# Altium project aboalrobotatESP32S2.PrjPcb
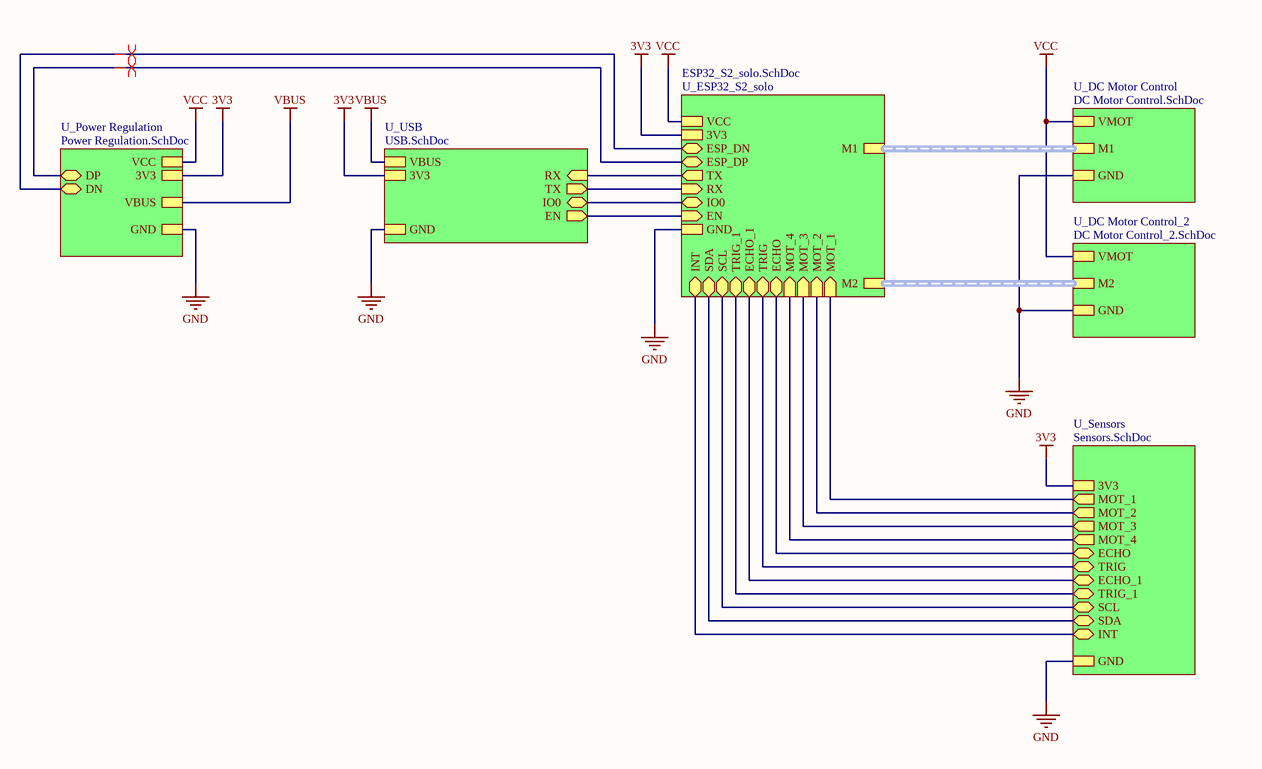
[diagram p0: Block Diagram.SchDoc]
7 sheets, 121 parts. Net scope: strictly hierarchical (ports join the sheet entries above them; power ports are local).
Board file: ESP32_HID.PcbDoc
Sheets:
  Block Diagram.SchDoc
    U_ESP32_S2_solo = ESP32_S2_solo.SchDoc
    U_Power Regulation = Power Regulation.SchDoc
    U_USB = USB.SchDoc
    U_DC Motor Control = DC Motor Control.SchDoc
    U_DC Motor Control_2 = DC Motor Control_2.SchDoc
    U_Sensors = Sensors.SchDoc

## Sheet Block Diagram.SchDoc: Block diagram
size A4; Engineer: Naif Aljophani; DocumentNumber: 1; Revision: V1.0; SheetNumber: 1; SheetTotal: 7

### Sub-sheets
U_DC Motor Control = DC Motor Control.SchDoc: VMOT, GND, M1 (harness M1)
U_DC Motor Control_2 = DC Motor Control_2.SchDoc: VMOT, GND, M2 (harness M2)
U_ESP32_S2_solo = ESP32_S2_solo.SchDoc: 3V3, GND, VCC, IO0 (bidir), EN (in), TX (out), RX (in), M1 (harness M1), M2 (harness M2), ESP_DN (bidir), ESP_DP (bidir), MOT_1 (in), MOT_2 (in), MOT_3 (in), MOT_4 (in), TRIG (bidir), ECHO (bidir), TRIG_1 (bidir), ECHO_1 (bidir), SDA (bidir), INT (bidir), SCL (bidir)
U_Power Regulation = Power Regulation.SchDoc: 3V3, GND, VCC, VBUS, DP (bidir), DN (bidir)
U_Sensors = Sensors.SchDoc: 3V3, MOT_1 (out), MOT_2 (out), MOT_3 (out), MOT_4 (out), GND, TRIG (bidir), ECHO (bidir), TRIG_1 (bidir), ECHO_1 (bidir), SDA (bidir), INT (bidir), SCL (bidir)
U_USB = USB.SchDoc: GND, EN (out), IO0 (bidir), VBUS, RX (in), TX (out), 3V3

### Nets
3V3: sheet U_ESP32_S2_solo/3V3, sheet U_Power Regulation/3V3, sheet U_USB/3V3, sheet U_Sensors/3V3
GND: sheet U_ESP32_S2_solo/GND, sheet U_Power Regulation/GND, sheet U_USB/GND, sheet U_DC Motor Control/GND, sheet U_DC Motor Control_2/GND, sheet U_Sensors/GND
VBUS: sheet U_Power Regulation/VBUS, sheet U_USB/VBUS
VCC: sheet U_ESP32_S2_solo/VCC, sheet U_Power Regulation/VCC, sheet U_DC Motor Control/VMOT, sheet U_DC Motor Control_2/VMOT
D1_N: sheet U_ESP32_S2_solo/ESP_DN, sheet U_Power Regulation/DN
D1_P: sheet U_ESP32_S2_solo/ESP_DP, sheet U_Power Regulation/DP
EN: sheet U_ESP32_S2_solo/EN, sheet U_USB/EN
GLCD_CON1: sheet U_ESP32_S2_solo/SCL, sheet U_Sensors/SCL
GLCD_CON2: sheet U_ESP32_S2_solo/SDA, sheet U_Sensors/SDA
GLCD_CON3: sheet U_ESP32_S2_solo/INT, sheet U_Sensors/INT
IO0: sheet U_ESP32_S2_solo/IO0, sheet U_USB/IO0
IO1: sheet U_ESP32_S2_solo/TRIG_1, sheet U_Sensors/TRIG_1
IO2: sheet U_ESP32_S2_solo/ECHO_1, sheet U_Sensors/ECHO_1
IO3: sheet U_ESP32_S2_solo/MOT_4, sheet U_Sensors/MOT_4
IO16: sheet U_ESP32_S2_solo/MOT_1, sheet U_Sensors/MOT_1
IO17: sheet U_ESP32_S2_solo/MOT_2, sheet U_Sensors/MOT_2
IO18: sheet U_ESP32_S2_solo/MOT_3, sheet U_Sensors/MOT_3
IO33: sheet U_ESP32_S2_solo/TRIG, sheet U_Sensors/TRIG
IO45: sheet U_ESP32_S2_solo/ECHO, sheet U_Sensors/ECHO
UART1: sheet U_ESP32_S2_solo/RX, sheet U_USB/TX
UART2: sheet U_ESP32_S2_solo/TX, sheet U_USB/RX

### Buses and harness runs
harness sheet U_DC Motor Control/M1 = sheet U_ESP32_S2_solo/M1
harness sheet U_DC Motor Control_2/M2 = sheet U_ESP32_S2_solo/M2

### Layout directives
differential pair: D1_N, D1_P

## Sheet ESP32_S2_solo.SchDoc
size A4; Engineer: Naif Aljohani; DocumentNumber: 3; Revision: v1.0; SheetNumber: 2; SheetTotal: 7; SPICEModelCacheSFRKXKUM: <root> / <DocumentId>SFRKXKUM</DocumentId> / </root>
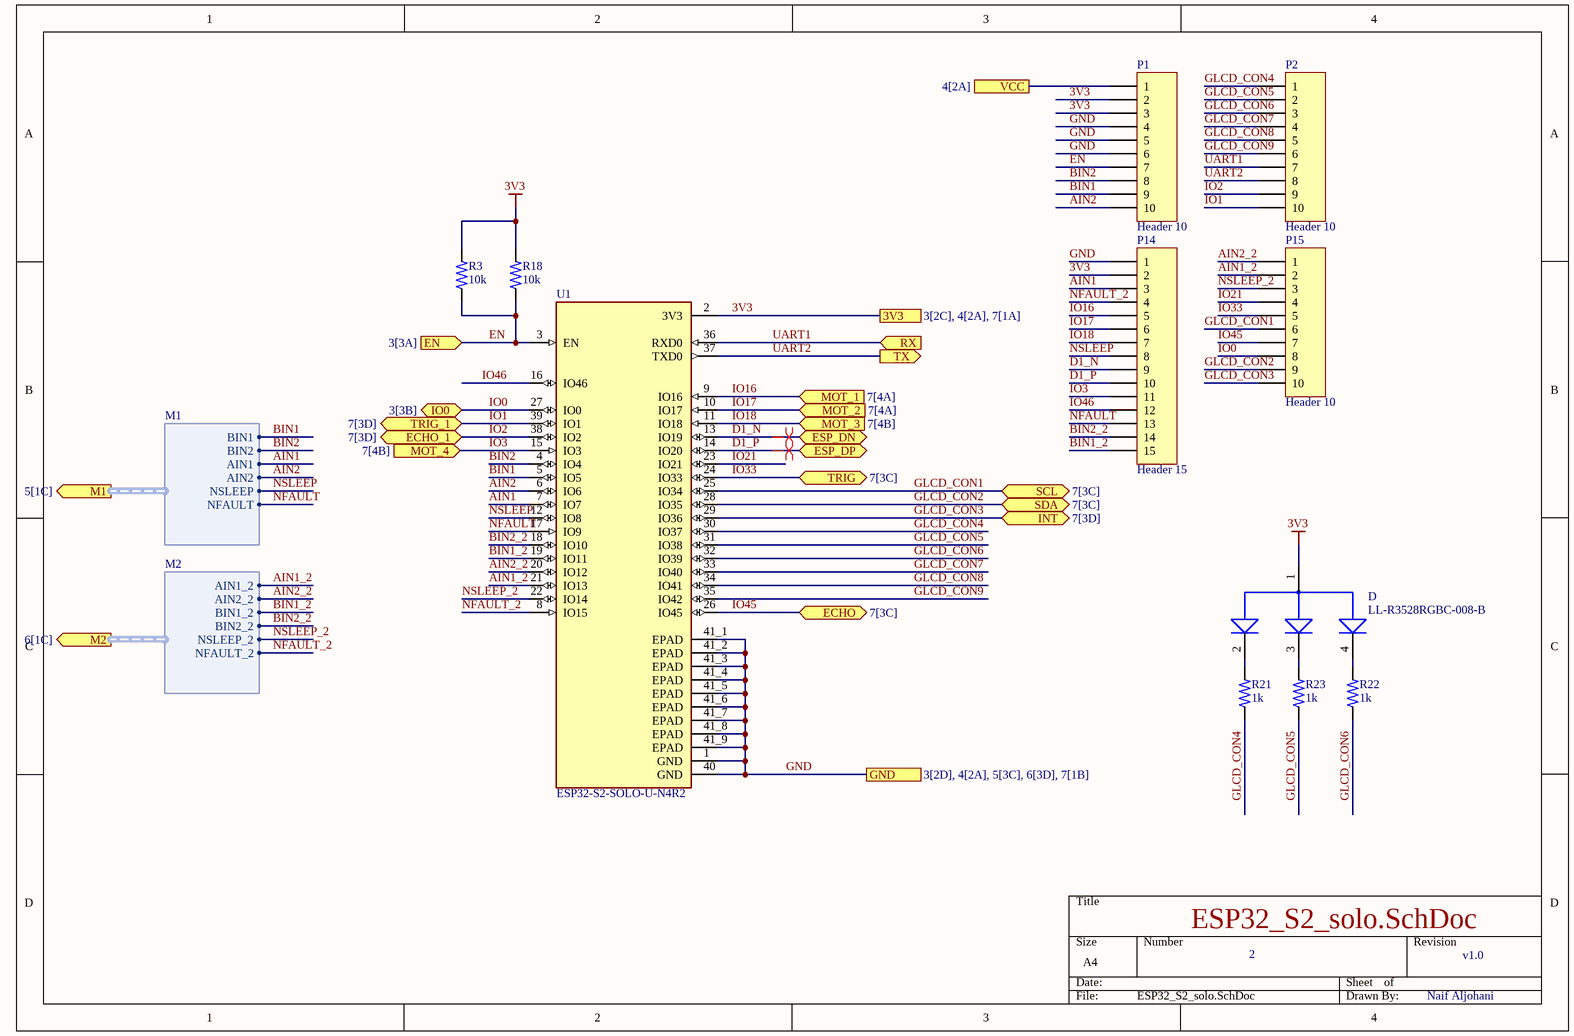
[diagram p1: ESP32_S2_solo.SchDoc]

### Parts
D  LL-R3528RGBC-008-B  [LED_LL-R3528RGBC-008-B]
P1  Header 10  [HDR1X10]
P2  Header 10  [HDR1X10]
P14  Header 15  [HDR1X15]
P15  Header 10  [HDR1X10]
R3  10k  [RESC3115X65N]
R18  10k  [RESC3115X65N]
R21  1k  [RESC3115X65N]
R22  1k  [RESC3115X65N]
R23  1k  [RESC3115X65N]
U1  ESP32-S2-SOLO-U-N4R2  [XCVR_ESP32-S2-SOLO-U-N4R2]

### Ports
3V3 (see 3[2C], 4[2A], 7[1A]), ECHO (bidir, see 7[3C]), ECHO_1 (bidir, see 7[3D]), EN (in, see 3[3A]), ESP_DN (bidir), ESP_DP (bidir), GND (see 3[2D], 4[2A], 5[3C], 6[3D], 7[1B]), INT (bidir, see 7[3D]), IO0 (bidir, see 3[3B]), M1 (out, harness M1, see 5[1C]), M2 (out, harness M2, see 6[1C]), MOT_1 (in, see 7[4A]), MOT_2 (in, see 7[4A]), MOT_3 (in, see 7[4B]), MOT_4 (in, see 7[4B]), RX (in), SCL (bidir, see 7[3C]), SDA (bidir, see 7[3C]), TRIG (bidir, see 7[3C]), TRIG_1 (bidir, see 7[3D]), TX (out), VCC (see 4[2A])

### Harnesses
M1: BIN1, BIN2, AIN1, AIN2, NSLEEP, NFAULT
M2: AIN1_2, AIN2_2, BIN1_2, BIN2_2, NSLEEP_2, NFAULT_2

### Nets
3V3: D.1(COMM_ANODE) P1.2 P1.3 P14.2 R3.2 R18.2 U1.2(3V3) ; port 3V3
GND: P1.4 P1.5 P1.6 P14.1 U1.1(GND) U1.40(GND) U1.41_1(EPAD) U1.41_2(EPAD) U1.41_3(EPAD) U1.41_4(EPAD) U1.41_5(EPAD) U1.41_6(EPAD) U1.41_7(EPAD) U1.41_8(EPAD) U1.41_9(EPAD) ; port GND
VCC: P1.1 ; port VCC
AIN1: P14.3 U1.7(IO7) ; port M1.AIN1
AIN1_2: P15.2 U1.21(IO13) ; port M2.AIN1_2
AIN2: P1.10 U1.6(IO6) ; port M1.AIN2
AIN2_2: P15.1 U1.20(IO12) ; port M2.AIN2_2
BIN1: P1.9 U1.5(IO5) ; port M1.BIN1
BIN1_2: P14.15 U1.19(IO11) ; port M2.BIN1_2
BIN2: P1.8 U1.4(IO4) ; port M1.BIN2
BIN2_2: P14.14 U1.18(IO10) ; port M2.BIN2_2
D1_N: P14.9 U1.13(IO19) ; port ESP_DN
D1_P: P14.10 U1.14(IO20) ; port ESP_DP
EN: P1.7 R3.1 R18.1 U1.3(EN) ; port EN
GLCD_CON1: P15.6 U1.25(IO34) ; port SCL
GLCD_CON2: P15.9 U1.28(IO35) ; port SDA
GLCD_CON3: P15.10 U1.29(IO36) ; port INT
GLCD_CON4: P2.1 R21.1 U1.30(IO37)
GLCD_CON5: P2.2 R23.1 U1.31(IO38)
GLCD_CON6: P2.3 R22.1 U1.32(IO39)
GLCD_CON7: P2.4 U1.33(IO40)
GLCD_CON8: P2.5 U1.34(IO41)
GLCD_CON9: P2.6 U1.35(IO42)
IO0: P15.8 U1.27(IO0) ; port IO0
IO1: P2.10 U1.39(IO1) ; port TRIG_1
IO2: P2.9 U1.38(IO2) ; port ECHO_1
IO3: P14.11 U1.15(IO3) ; port MOT_4
IO16: P14.5 U1.9(IO16) ; port MOT_1
IO17: P14.6 U1.10(IO17) ; port MOT_2
IO18: P14.7 U1.11(IO18) ; port MOT_3
IO21: P15.4 U1.23(IO21)
IO33: P15.5 U1.24(IO33) ; port TRIG
IO45: P15.7 U1.26(IO45) ; port ECHO
IO46: P14.12 U1.16(IO46)
NFAULT: P14.13 U1.17(IO9) ; port M1.NFAULT
NFAULT_2: P14.4 U1.8(IO15) ; port M2.NFAULT_2
NSLEEP: P14.8 U1.12(IO8) ; port M1.NSLEEP
NSLEEP_2: P15.3 U1.22(IO14) ; port M2.NSLEEP_2
UART1: P2.7 U1.36(RXD0) ; port RX
UART2: P2.8 U1.37(TXD0) ; port TX
NetD_2: D.2(CATHODE_RED) R21.2
NetD_3: D.3(CATHODE_GREEN) R23.2
NetD_4: D.4(CATHODE_BLUE) R22.2

### Layout directives
differential pair: D1_N, D1_P

### Library data of the parts
D = LL-R3528RGBC-008-B: LED; SMD; 3528, PLCC2; RGB; 3.5x2.8mm; 120Â°; Red lumin: 1; MF: Lucky Light; Package: PLCC-2 Lucky Light; Availability: Unavailable; Value: *; MP: LL-R3528RGBC-008-B; SnapEDA_Link: https://www.snapeda.com/parts/LL-R3528RGBC-008-B/Lucky%20Light/view-part/47649/?ref=snap; Price: None
P1 P2 P15 = Header 10: Header, 10-Pin; LatestRevisionDate: 17-Jul-2002; LatestRevisionNote: Re-released for DXP Platform.; Publisher: Altium Limited
P14 = Header 15: Header, 15-Pin; LatestRevisionDate: 17-Jul-2002; LatestRevisionNote: Re-released for DXP Platform.; Publisher: Altium Limited
R3 R18 R21-R23 = 1-1879462-4: RL73H 2B R43 1% 5K RL; MF: {'manufacturer': u'TE Connectivity'}; Package: None; Price: None; Value: *; MP: 1-1879462-4; Availability: Unavailable
U1 = ESP32-S2-SOLO-U-N4R2: MF: {'manufacturer': u'Espressif Systems'}; Package: None; Price: None; MP: ESP32-S2-SOLO-U-N4R2; Availability: Unavailable; Value: *

## Sheet Power Regulation.SchDoc
size A4; Engineer: Naif Aljohani; DocumentNumber: 7; Revision: v1.0; SheetNumber: 4; SheetTotal: 7
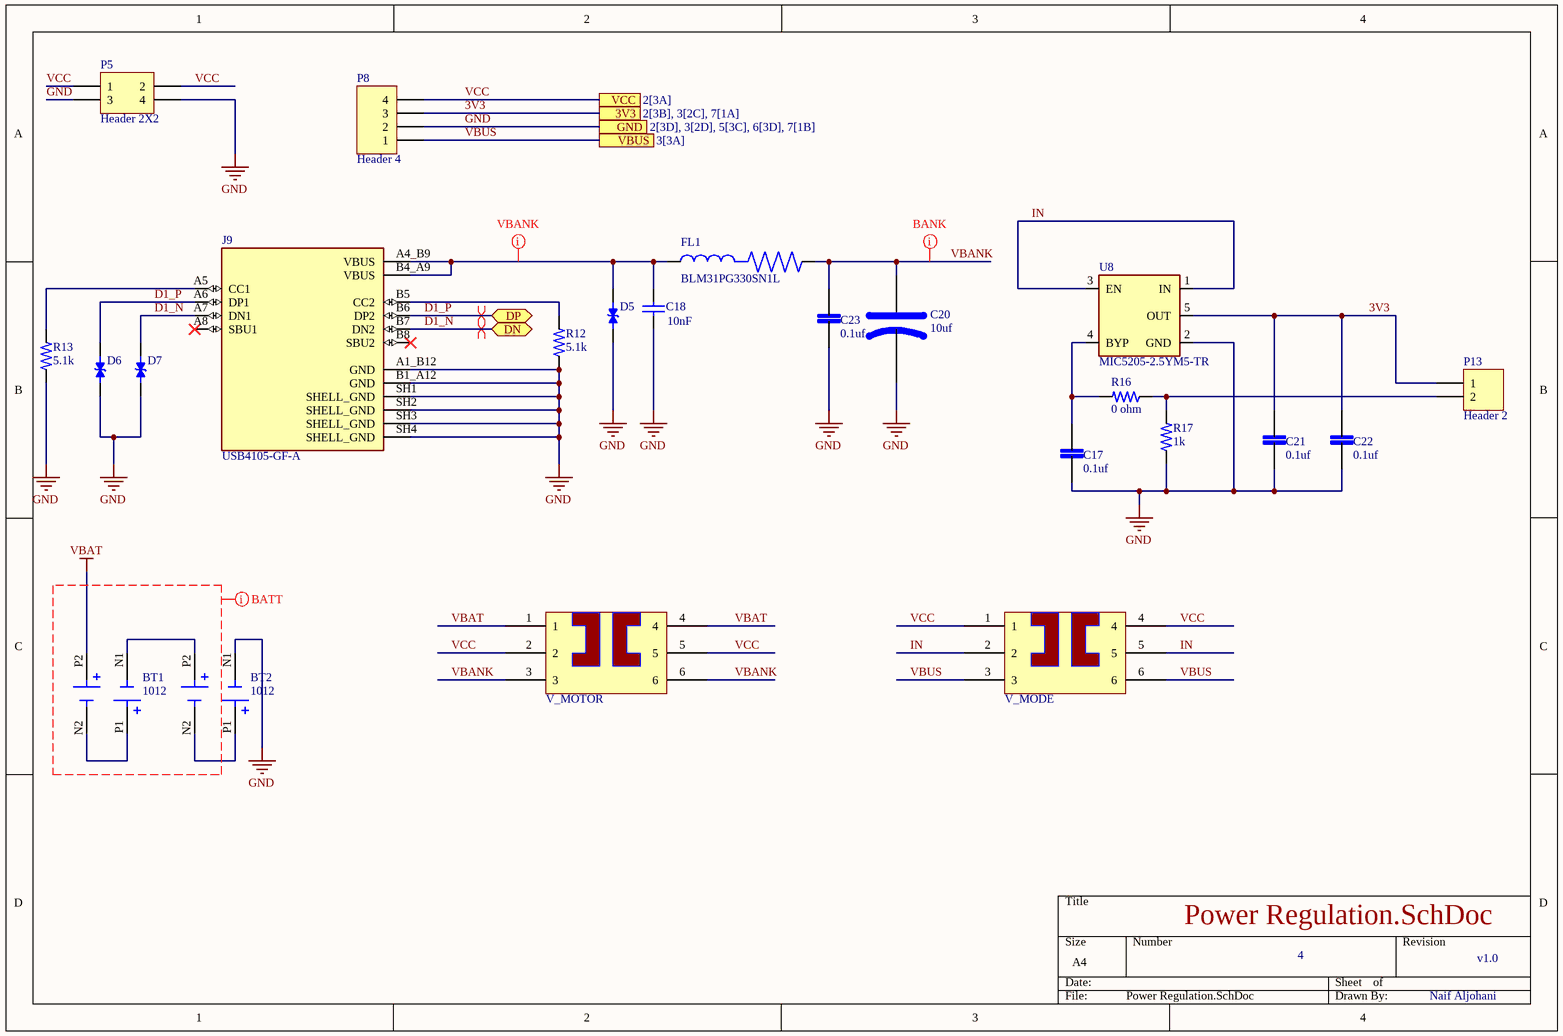
[diagram p2: Power Regulation.SchDoc]

### Parts
BT1  1012  [BAT_1012]
BT2  1012  [BAT_1012]
C17  0.1uf  [CAPC2012X140N]
C18  value 10nF  [C1206]  (hidden comment: Cap Semi)
C20  10uf  [CAPAE660X550N]
C21  0.1uf  [CAPC2012X140N]
C22  0.1uf  [CAPC2012X140N]
C23  0.1uf  [CAPC2012X140N]
D5  LESD5D5.0CT1G  [TVS_LESD5D5.0CT1G]  (value not drawn)
D6  LESD5D5.0CT1G  [TVS_LESD5D5.0CT1G]  (value not drawn)
D7  LESD5D5.0CT1G  [TVS_LESD5D5.0CT1G]  (value not drawn)
FL1  BLM31PG330SN1L  [BEADC3216X130N]
J9  USB4105-GF-A  [GCT_USB4105-GF-A]
P5  Header 2X2  [HDR2X2]
P8  Header 4  [HDR1X4]
P13  Header 2  [HDR1X2]
R12  5.1k  [RESC3115X65N]
R13  5.1k  [RESC3115X65N]
R16  0 ohm  [RESC3115X65N]
R17  1k  [RESC3115X65N]
U8  MIC5205-2.5YM5-TR  [SOT95P280X145-5N]
V_MODE  MS-22C01-G010  [G Switch]  (value not drawn)
V_MOTOR  MS-22C01-G010  [G Switch]  (value not drawn)

### Ports
3V3 (see 2[3B], 3[2C], 7[1A]), DN (bidir), DP (bidir), GND (see 2[3D], 3[2D], 5[3C], 6[3D], 7[1B]), VBUS (see 3[3A]), VCC (see 2[3A])

### Nets
3V3: C21.2 C22.2 P8.3 P13.1 U8.5(OUT) ; port 3V3
GND: BT2.N1(NEG1) C17.1 C18.1 C20.N C21.1 C22.1 C23.1 D5.1 D6.1 D7.1 J9.A1_B12(GND) J9.B1_A12(GND) J9.SH1(SHELL_GND) J9.SH2(SHELL_GND) J9.SH3(SHELL_GND) J9.SH4(SHELL_GND) P5.3 P5.4 P8.2 R12.1 R13.1 R17.1 U8.2(GND) ; port GND
VBAT: BT1.P2(POS2) V_MOTOR.1 V_MOTOR.4
VBUS: P8.1 V_MODE.3 V_MODE.6 ; port VBUS
VCC: P5.1 P5.2 P8.4 V_MODE.1 V_MODE.4 V_MOTOR.2 V_MOTOR.5 ; port VCC
D1_N: D7.2 J9.A7(DN1) J9.B7(DN2) ; port DN
D1_P: D6.2 J9.A6(DP1) J9.B6(DP2) ; port DP
IN: U8.1(IN) U8.3(EN) V_MODE.2 V_MODE.5
VBANK: C20.P C23.2 FL1.2 V_MOTOR.3 V_MOTOR.6
NetBT1_N1: BT1.N1(NEG1) BT2.P2(POS2)
NetBT1_N2: BT1.N2(NEG2) BT1.P1(POS1)
NetBT2_N2: BT2.N2(NEG2) BT2.P1(POS1)
NetC17_2: C17.2 R16.2 U8.4(BYP)
NetC18_2: C18.2 D5.2 FL1.1 J9.A4_B9(VBUS) J9.B4_A9(VBUS)
NetJ9_A5: J9.A5(CC1) R13.2
NetJ9_B5: J9.B5(CC2) R12.2
NetP13_2: P13.2 R16.1 R17.2

Not connected (* = marked no-connect by the designer): J9 A8(SBU1)* B8(SBU2)*

### Layout directives
differential pair: D1_N, D1_P
rule Width Constraint [Pref Width = 0.5mm    Min Width = 0.254mm    Max Width = 1mm]: (no net found under the mark)
rule Width Constraint [Pref Width = 0.5mm    Min Width = 0.3mm    Max Width = 1mm]: VBANK
rule Width Constraint [Pref Width = 0.254mm    Min Width = 0.254mm    Max Width = 0.5mm]: NetC18_2

### Library data of the parts
C17 C21-C23 = LD051A121KAB2A: 120PF 100V 10% 0805; MF: {'manufacturer': u'AVX'}; Package: None; Price: None; Value: *; MP: LD051A121KAB2A; Availability: Unavailable
C18 = Cap Semi: Capacitor (Semiconductor SIM Model); Published: 8-Jun-2000; LatestRevisionDate: 29-May-2009; LatestRevisionNote: IPC-7351 Footprint Added.; PackageReference: C1206; Publisher: Altium Limited; PackageDescription: Chip Capacitor
C20 = UWX1H100MCL1GB
D5-D7 = LESD5D5.0CT1G: MF: {'manufacturer': u'Leshan Radio Co.'}; Package: None; Price: None; Value: *; MP: LESD5D5.0CT1G; Availability: Unavailable
FL1 = BLM31PG330SN1L: Ferrite Beads Multi-Layer 33Ohm 25% 100MHz 6A 9mOhm DCR 1206 T/R; MF: {'manufacturer': u'Murata Electronics'}; Package: None; Price: None; Value: *; MP: BLM31PG330SN1L; Availability: Unavailable
J9 = USB4105-GF-A: MF: {'manufacturer': u'GCT'}; Package: None; Price: None; Value: *; MP: USB4105-GF-A; Availability: Unavailable
P5 = Header 2X2: Header, 2-Pin, Dual row; LatestRevisionDate: 17-Jul-2002; LatestRevisionNote: Re-released for DXP Platform.; Publisher: Altium Limited
P8 = Header 4: Header, 4-Pin; LatestRevisionDate: 17-Jul-2002; LatestRevisionNote: Re-released for DXP Platform.; Publisher: Altium Limited
P13 = Header 2: Header, 2-Pin; LatestRevisionDate: 17-Jul-2002; LatestRevisionNote: Re-released for DXP Platform.; Publisher: Altium Limited
R12 R13 R16 R17 = 1-1879462-4: as R3 on sheet ESP32_S2_solo; Package: None; Price: None; Value: *; MP: 1-1879462-4; Availability: Unavailable
U8 = MIC5205-2.5YM5-TR: MIC5205 Series 3 V Fixed Output 150 mA SMT Low-Noise LDO Regulator - SOT-23-5; MF: {'manufacturer': u'Microchip Technology'}; Price: None; MP: MIC5205-2.5YM5-TR; Availability: Unavailable; Value: *; Package: None
V_MODE V_MOTOR = G-Switch: Standing paste 1A DPDT 6V Black 10000 times SMD Slide Switches ROHS
BT1 BT2 = 1012: Value: *; MP: 1012; Price: None; Package: None; Availability: Unavailable

## Sheet USB.SchDoc
size A4; Engineer: Naif aljohani; DocumentNumber: 4; Revision: v1.0; SheetNumber: 3; SheetTotal: 7; SPICEModelCacheVKQZRFRK: <root> / <DocumentId>VKQZRFRK</DocumentId> / </root>
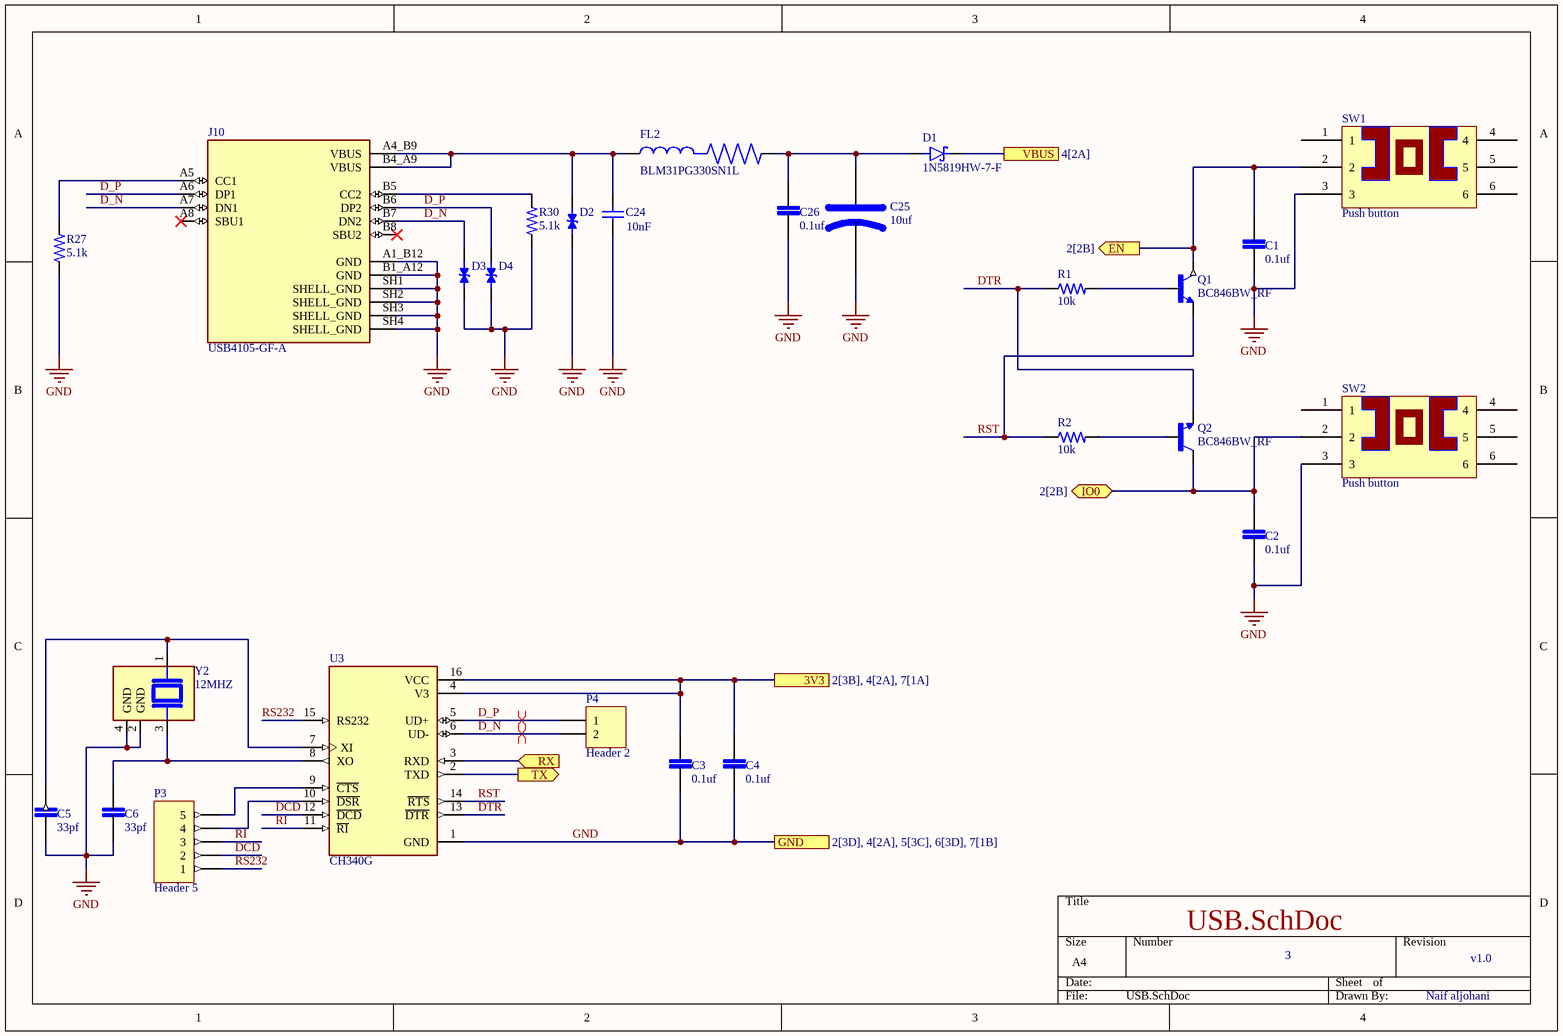
[diagram p3: USB.SchDoc]

### Parts
C1  0.1uf  [CAPC2012X140N]
C2  0.1uf  [CAPC2012X140N]
C3  0.1uf  [CAPC2012X140N]
C4  0.1uf  [CAPC2012X140N]
C5  33pf  [CAPC2012X140N]
C6  33pf  [CAPC2012X140N]
C24  value 10nF  [C1206]  (hidden comment: Cap Semi)
C25  10uf  [CAPAE660X550N]
C26  0.1uf  [CAPC2012X140N]
D1  1N5819HW-7-F  [SOD3715X145N]
D2  LESD5D5.0CT1G  [TVS_LESD5D5.0CT1G]  (value not drawn)
D3  LESD5D5.0CT1G  [TVS_LESD5D5.0CT1G]  (value not drawn)
D4  LESD5D5.0CT1G  [TVS_LESD5D5.0CT1G]  (value not drawn)
FL2  BLM31PG330SN1L  [BEADC3216X130N]
J10  USB4105-GF-A  [GCT_USB4105-GF-A]
P3  Header 5  [HDR1X5]
P4  Header 2  [HDR1X2]
Q1  BC846BW_RF  [TRANS_BC846BW_RF]
Q2  BC846BW_RF  [TRANS_BC846BW_RF]
R1  10k  [RESC3115X65N]
R2  10k  [RESC3115X65N]
R27  5.1k  [RESC3115X65N]
R30  5.1k  [RESC3115X65N]
SW1  Push button  [XKB5858-Z-TP-75]
SW2  Push button  [XKB5858-Z-TP-75]
U3  CH340G  [SOIC127P600X180-16N]
Y2  12MHZ  [XTAL_ABM8W-32.0000MHZ-6-B1U-T3]

### Ports
3V3 (see 2[3B], 4[2A], 7[1A]), EN (out, see 2[2B]), GND (see 2[3D], 4[2A], 5[3C], 6[3D], 7[1B]), IO0 (bidir, see 2[2B]), RX (in), TX (out), VBUS (see 4[2A])

### Nets
3V3: C3.2 C4.2 U3.4(V3) U3.16(VCC) ; port 3V3
GND: C1.1 C2.1 C3.1 C4.1 C5.2 C6.2 C24.1 C25.N C26.1 D2.1 D3.1 D4.1 J10.A1_B12(GND) J10.B1_A12(GND) J10.SH1(SHELL_GND) J10.SH2(SHELL_GND) J10.SH3(SHELL_GND) J10.SH4(SHELL_GND) R27.1 R30.1 SW1.3 SW2.3 U3.1(GND) Y2.2(GND) Y2.4(GND) ; port GND
VBUS: D1.C(K) ; port VBUS
D_N: D3.2 J10.A7(DN1) J10.B7(DN2) P4.2 U3.6(UD-)
D_P: D4.2 J10.A6(DP1) J10.B6(DP2) P4.1 U3.5(UD+)
DCD: P3.2 U3.12(~{DCD})
DTR: Q2.2(E) R1.1 U3.13(~{DTR})
EN: C1.2 Q1.3(C) SW1.2 ; port EN
IO0: C2.2 Q2.3(C) SW2.2 ; port IO0
RI: P3.3 U3.11(~{RI})
RS232: P3.1 U3.15(RS232)
RST: Q1.2(E) R2.1 U3.14(~{RTS})
UART1: U3.2(TXD) ; port TX
UART2: U3.3(RXD) ; port RX
NetC5_1: C5.1 U3.7(XI) Y2.1
NetC6_1: C6.1 U3.8(XO) Y2.3
NetC24_2: C24.2 D2.2 FL2.1 J10.A4_B9(VBUS) J10.B4_A9(VBUS)
NetC25_P: C25.P C26.2 D1.A FL2.2
NetJ10_A5: J10.A5(CC1) R27.2
NetJ10_B5: J10.B5(CC2) R30.2
NetP3_4: P3.4 U3.10(~{DSR})
NetP3_5: P3.5 U3.9(~{CTS})
NetQ1_1: Q1.1(B) R1.2
NetQ2_1: Q2.1(B) R2.2

Not connected (* = marked no-connect by the designer): J10 A8(SBU1)* B8(SBU2)*; SW1 1 4 5 6; SW2 1 4 5 6

### Layout directives
differential pair: D_N, D_P

### Library data of the parts
C1-C6 C26 = LD051A121KAB2A: as C17 on sheet Power Regulation; Package: None; Price: None; Value: *; MP: LD051A121KAB2A; Availability: Unavailable
C24 = Cap Semi: Capacitor (Semiconductor SIM Model); Published: 8-Jun-2000; LatestRevisionDate: 29-May-2009; LatestRevisionNote: IPC-7351 Footprint Added.; PackageReference: C1206; Publisher: Altium Limited; PackageDescription: Chip Capacitor
C25 = UWX1H100MCL1GB
D1 = 1N5819HW-7-F: 1N5819HW Series 40 V 1 A Surface Mount Schottky Barrier Rectifier - SOD-123; MF: {'manufacturer': u'Diodes Inc.'}; Package: None; Price: None; Value: *; MP: 1N5819HW-7-F; Availability: Unavailable
D2-D4 = LESD5D5.0CT1G: as D5 on sheet Power Regulation; Package: None; Price: None; Value: *; MP: LESD5D5.0CT1G; Availability: Unavailable
FL2 = BLM31PG330SN1L: as FL1 on sheet Power Regulation; Package: None; Price: None; Value: *; MP: BLM31PG330SN1L; Availability: Unavailable
J10 = USB4105-GF-A: MF: {'manufacturer': u'GCT'}; Package: None; Price: None; Value: *; MP: USB4105-GF-A; Availability: Unavailable
P3 = Header 5: Header, 5-Pin; LatestRevisionDate: 17-Jul-2002; LatestRevisionNote: Re-released for DXP Platform.; Publisher: Altium Limited
P4 = Header 2: Header, 2-Pin; LatestRevisionDate: 17-Jul-2002; LatestRevisionNote: Re-released for DXP Platform.; Publisher: Altium Limited
Q1 Q2 = BC846BW_RF: MF: {'manufacturer': u'Taiwan Semiconductor'}; Package: None; Price: None; Value: *; MP: BC846BW_RF; Availability: Unavailable
R1 R2 R27 R30 = 1-1879462-4: as R3 on sheet ESP32_S2_solo; Package: None; Price: None; Value: *; MP: 1-1879462-4; Availability: Unavailable
SW1 SW2 = XKB5858-Z-TP-75: 250V 30V LATCHING Standing paste 100000 Times Without 160gf 100mA SMD Pushbutton Switches ROHS; ComponentLink1Description: Data sheet; ComponentLink1URL: https://www.lcsc.com/datasheet/lcsc_datasheet_2110111430_XKB-Connection-XKB5858-Z-TP-75_C692487.pdf
U3 = CH340G: MF: {'manufacturer': u'WCH'}; MP: CH340G; Package: None; Price: None; Value: *; Availability: Unavailable
Y2 = ABM8W-32.0000MHZ-6-B1U-T3: MF: {'manufacturer': u'Abracon'}; Package: None; Price: None; Value: *; MP: ABM8W-32.0000MHZ-6-B1U-T3; Availability: Unavailable

## Sheet DC Motor Control.SchDoc
size A4; Engineer: Naif Aljohani; DocumentNumber: 6; Revision: v1.0; SheetNumber: 5; SheetTotal: 7
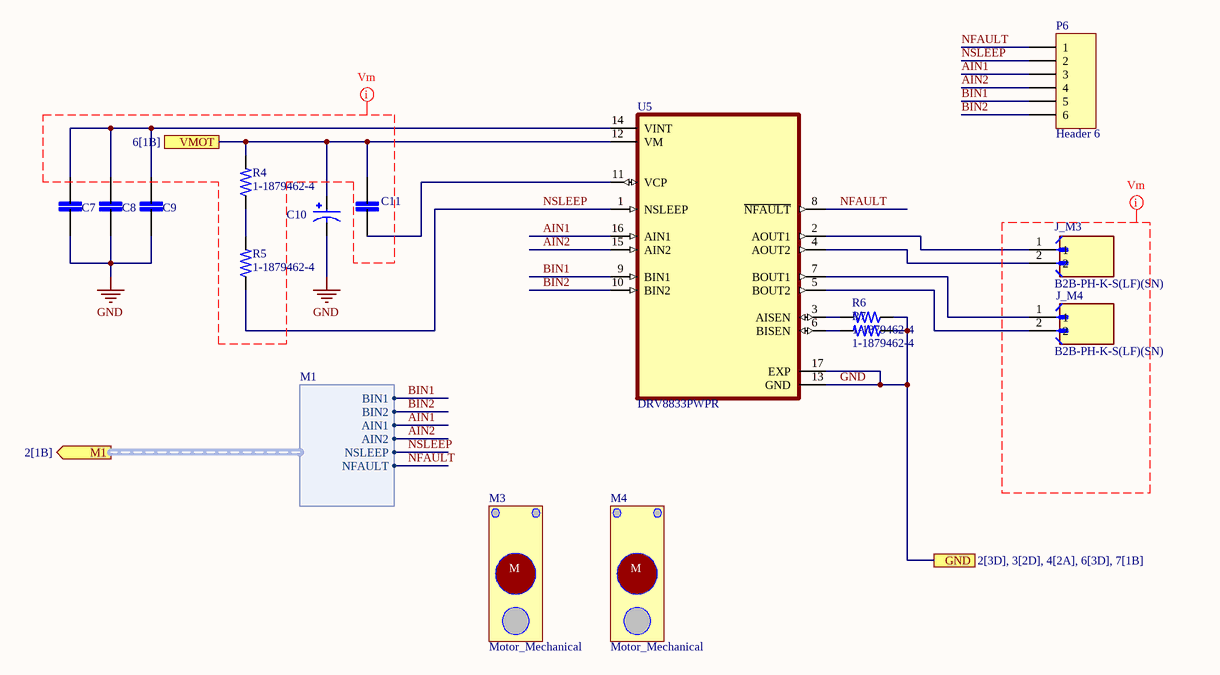
[diagram p4: DC Motor Control.SchDoc]

### Parts
C7  LD051A121KAB2A  [CAPC2012X140N]  (value not drawn)
C8  LD051A121KAB2A  [CAPC2012X140N]  (value not drawn)
C9  LD051A121KAB2A  [CAPC2012X140N]  (value not drawn)
C10  EEEHA1V101UP  [CAP_EEEHA1V101UP]  (value not drawn)
C11  LD051A121KAB2A  [CAPC2012X140N]  (value not drawn)
J_M3  B2B-PH-K-S(LF)(SN)  [JST_B2B-PH-K-S(LF)(SN)]
J_M4  B2B-PH-K-S(LF)(SN)  [JST_B2B-PH-K-S(LF)(SN)]
M3  Motor_Mechanical  [Motor_mechanical]
M4  Motor_Mechanical  [Motor_mechanical]
P6  Header 6  [HDR1X6]
R4  1-1879462-4  [RESC3115X65N]
R5  1-1879462-4  [RESC3115X65N]
R6  1-1879462-4  [RESC3115X65N]
R7  1-1879462-4  [RESC3115X65N]
U5  DRV8833PWPR  [IC_DRV8833PWPR]

### Ports
GND (see 2[3D], 3[2D], 4[2A], 6[3D], 7[1B]), M1 (out, harness M1, see 2[1B]), VMOT (see 6[1B])

### Harnesses
M1: BIN1, BIN2, AIN1, AIN2, NSLEEP, NFAULT

### Nets
GND: C7.2 C8.2 C9.2 C10.2 R6.1 R7.1 U5.13(GND) U5.17(EXP) ; port GND
VCC: C10.1 C11.1 R4.2 U5.12(VM) ; port VMOT
AIN1: P6.3 U5.16(AIN1) ; port M1.AIN1
AIN2: P6.4 U5.15(AIN2) ; port M1.AIN2
BIN1: P6.5 U5.9(BIN1) ; port M1.BIN1
BIN2: P6.6 U5.10(BIN2) ; port M1.BIN2
NFAULT: P6.1 U5.8(~{NFAULT}) ; port M1.NFAULT
NSLEEP: P6.2 R5.1 U5.1(NSLEEP) ; port M1.NSLEEP
NetC7_1: C7.1 C8.1 C9.1 U5.14(VINT)
NetC11_2: C11.2 U5.11(VCP)
NetJ_M3_1: J_M3.1 U5.2(AOUT1)
NetJ_M3_2: J_M3.2 U5.4(AOUT2)
NetJ_M4_1: J_M4.1 U5.7(BOUT1)
NetJ_M4_2: J_M4.2 U5.5(BOUT2)
NetR4_1: R4.1 R5.2
NetR6_2: R6.2 U5.3(AISEN)
NetR7_2: R7.2 U5.6(BISEN)

### Layout directives
net class Vm; rule Width Constraint [Pref Width = 0.5mm    Min Width = 0.354mm    Max Width = 1mm]: (no net found under the mark), GND

### Notes on the sheet
- (in symbol Motor_Mechanical) M

### Library data of the parts
C7-C9 C11 = LD051A121KAB2A: as C17 on sheet Power Regulation; Package: None; Price: None; Value: *; MP: LD051A121KAB2A; Availability: Unavailable
C10 = EEEHA1V101UP: MF: {'manufacturer': u'Panasonic'}; Value: *; MP: EEEHA1V101UP; Availability: Unavailable; Package: None; Price: None
J_M3 J_M4 = B2B-PH-K-S(LF)(SN): Connector Header Through Hole 2 position 0.079 (2.00mm); MF: JST; SnapEDA_Link: https://www.snapeda.com/parts/B2B-PH-K-S%20(LF)(SN)/JST/view-part/?ref=snap; Package: None; Value: *; MP: B2B-PH-K-S (LF)(SN); Check_prices: https://www.snapeda.com/parts/B2B-PH-K-S%20(LF)(SN)/JST/view-part/?ref=eda
P6 = Header 6: Header, 6-Pin; LatestRevisionDate: 17-Jul-2002; LatestRevisionNote: Re-released for DXP Platform.; Publisher: Altium Limited
R4-R7 = 1-1879462-4: as R3 on sheet ESP32_S2_solo; Package: None; Price: None; Value: *; MP: 1-1879462-4; Availability: Unavailable
U5 = DRV8833PWPR: 10.8-V, 2-A dual H-bridge motor driver with current regulation 16-HTSSOP -40 to 85; MF: {'manufacturer': u'Texas Instruments'}; Package: None; Price: None; MP: DRV8833PWPR; Availability: Unavailable; Value: *

## Sheet DC Motor Control_2.SchDoc
size A4; SheetNumber: 6; SheetTotal: 7
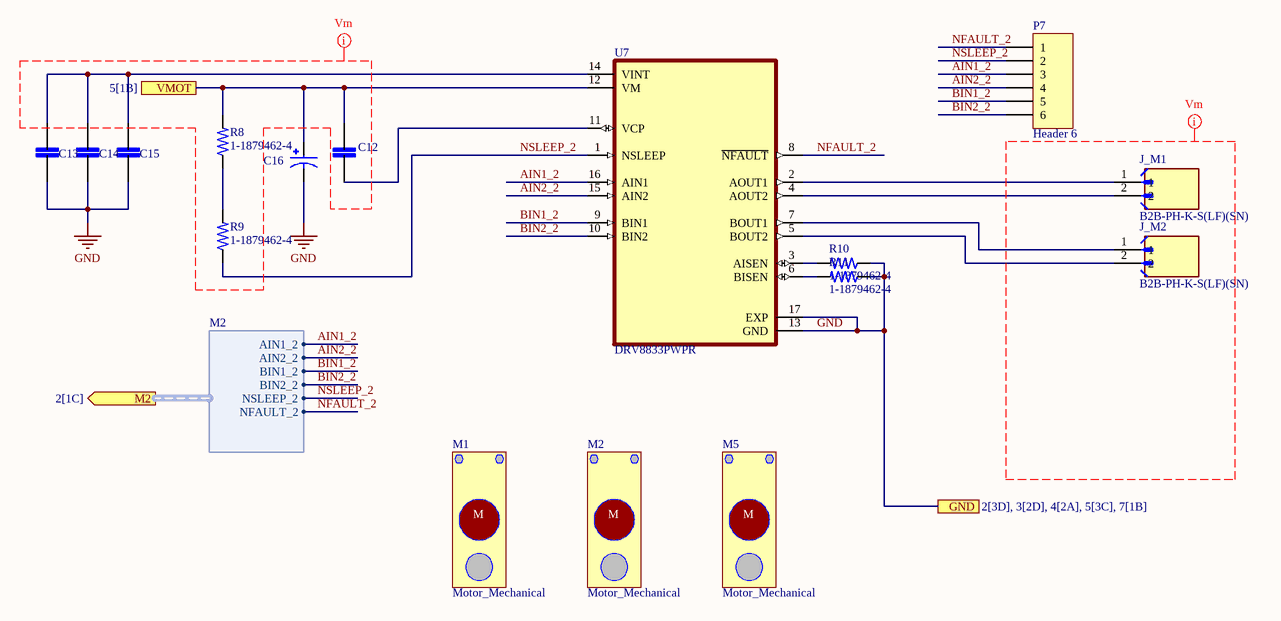
[diagram p5: DC Motor Control_2.SchDoc]

### Parts
C12  LD051A121KAB2A  [CAPC2012X140N]  (value not drawn)
C13  LD051A121KAB2A  [CAPC2012X140N]  (value not drawn)
C14  LD051A121KAB2A  [CAPC2012X140N]  (value not drawn)
C15  LD051A121KAB2A  [CAPC2012X140N]  (value not drawn)
C16  EEEHA1V101UP  [CAP_EEEHA1V101UP]  (value not drawn)
J_M1  B2B-PH-K-S(LF)(SN)  [JST_B2B-PH-K-S(LF)(SN)]
J_M2  B2B-PH-K-S(LF)(SN)  [JST_B2B-PH-K-S(LF)(SN)]
M1  Motor_Mechanical  [Motor_mechanical]
M2  Motor_Mechanical  [Motor_mechanical]
M5  Motor_Mechanical  [Motor_mechanical]
P7  Header 6  [HDR1X6]
R8  1-1879462-4  [RESC3115X65N]
R9  1-1879462-4  [RESC3115X65N]
R10  1-1879462-4  [RESC3115X65N]
R11  1-1879462-4  [RESC3115X65N]
U7  DRV8833PWPR  [IC_DRV8833PWPR]

### Ports
GND (see 2[3D], 3[2D], 4[2A], 5[3C], 7[1B]), M2 (out, harness M2, see 2[1C]), VMOT (see 5[1B])

### Harnesses
M2: AIN1_2, AIN2_2, BIN1_2, BIN2_2, NSLEEP_2, NFAULT_2

### Nets
GND: C13.2 C14.2 C15.2 C16.2 R10.1 R11.1 U7.13(GND) U7.17(EXP) ; port GND
VCC: C12.1 C16.1 R8.2 U7.12(VM) ; port VMOT
AIN1_2: P7.3 U7.16(AIN1) ; port M2.AIN1_2
AIN2_2: P7.4 U7.15(AIN2) ; port M2.AIN2_2
BIN1_2: P7.5 U7.9(BIN1) ; port M2.BIN1_2
BIN2_2: P7.6 U7.10(BIN2) ; port M2.BIN2_2
NFAULT_2: P7.1 U7.8(~{NFAULT}) ; port M2.NFAULT_2
NSLEEP_2: P7.2 R9.1 U7.1(NSLEEP) ; port M2.NSLEEP_2
NetC12_2: C12.2 U7.11(VCP)
NetC13_1: C13.1 C14.1 C15.1 U7.14(VINT)
NetJ_M1_1: J_M1.1 U7.2(AOUT1)
NetJ_M1_2: J_M1.2 U7.4(AOUT2)
NetJ_M2_1: J_M2.1 U7.7(BOUT1)
NetJ_M2_2: J_M2.2 U7.5(BOUT2)
NetR8_1: R8.1 R9.2
NetR10_2: R10.2 U7.3(AISEN)
NetR11_2: R11.2 U7.6(BISEN)

### Layout directives
net class Vm; rule Width Constraint [Pref Width = 0.5mm    Min Width = 0.354mm    Max Width = 1mm]: (no net found under the mark), GND

### Notes on the sheet
- (in symbol Motor_Mechanical) M

### Library data of the parts
C12-C15 = LD051A121KAB2A: as C17 on sheet Power Regulation; Package: None; Price: None; Value: *; MP: LD051A121KAB2A; Availability: Unavailable
C16 = EEEHA1V101UP: MF: {'manufacturer': u'Panasonic'}; Value: *; MP: EEEHA1V101UP; Availability: Unavailable; Package: None; Price: None
J_M1 J_M2 = B2B-PH-K-S(LF)(SN): as J_M3 on sheet DC Motor Control; SnapEDA_Link: https://www.snapeda.com/parts/B2B-PH-K-S%20(LF)(SN)/JST/view-part/?ref=snap; Package: None; Value: *; MP: B2B-PH-K-S (LF)(SN); Check_prices: https://www.snapeda.com/parts/B2B-PH-K-S%20(LF)(SN)/JST/view-part/?ref=eda
P7 = Header 6: Header, 6-Pin; LatestRevisionDate: 17-Jul-2002; LatestRevisionNote: Re-released for DXP Platform.; Publisher: Altium Limited
R8-R11 = 1-1879462-4: as R3 on sheet ESP32_S2_solo; Package: None; Price: None; Value: *; MP: 1-1879462-4; Availability: Unavailable
U7 = DRV8833PWPR: as U5 on sheet DC Motor Control; Package: None; Price: None; MP: DRV8833PWPR; Availability: Unavailable; Value: *

## Sheet Sensors.SchDoc
size A4; SheetNumber: 7; SheetTotal: 7
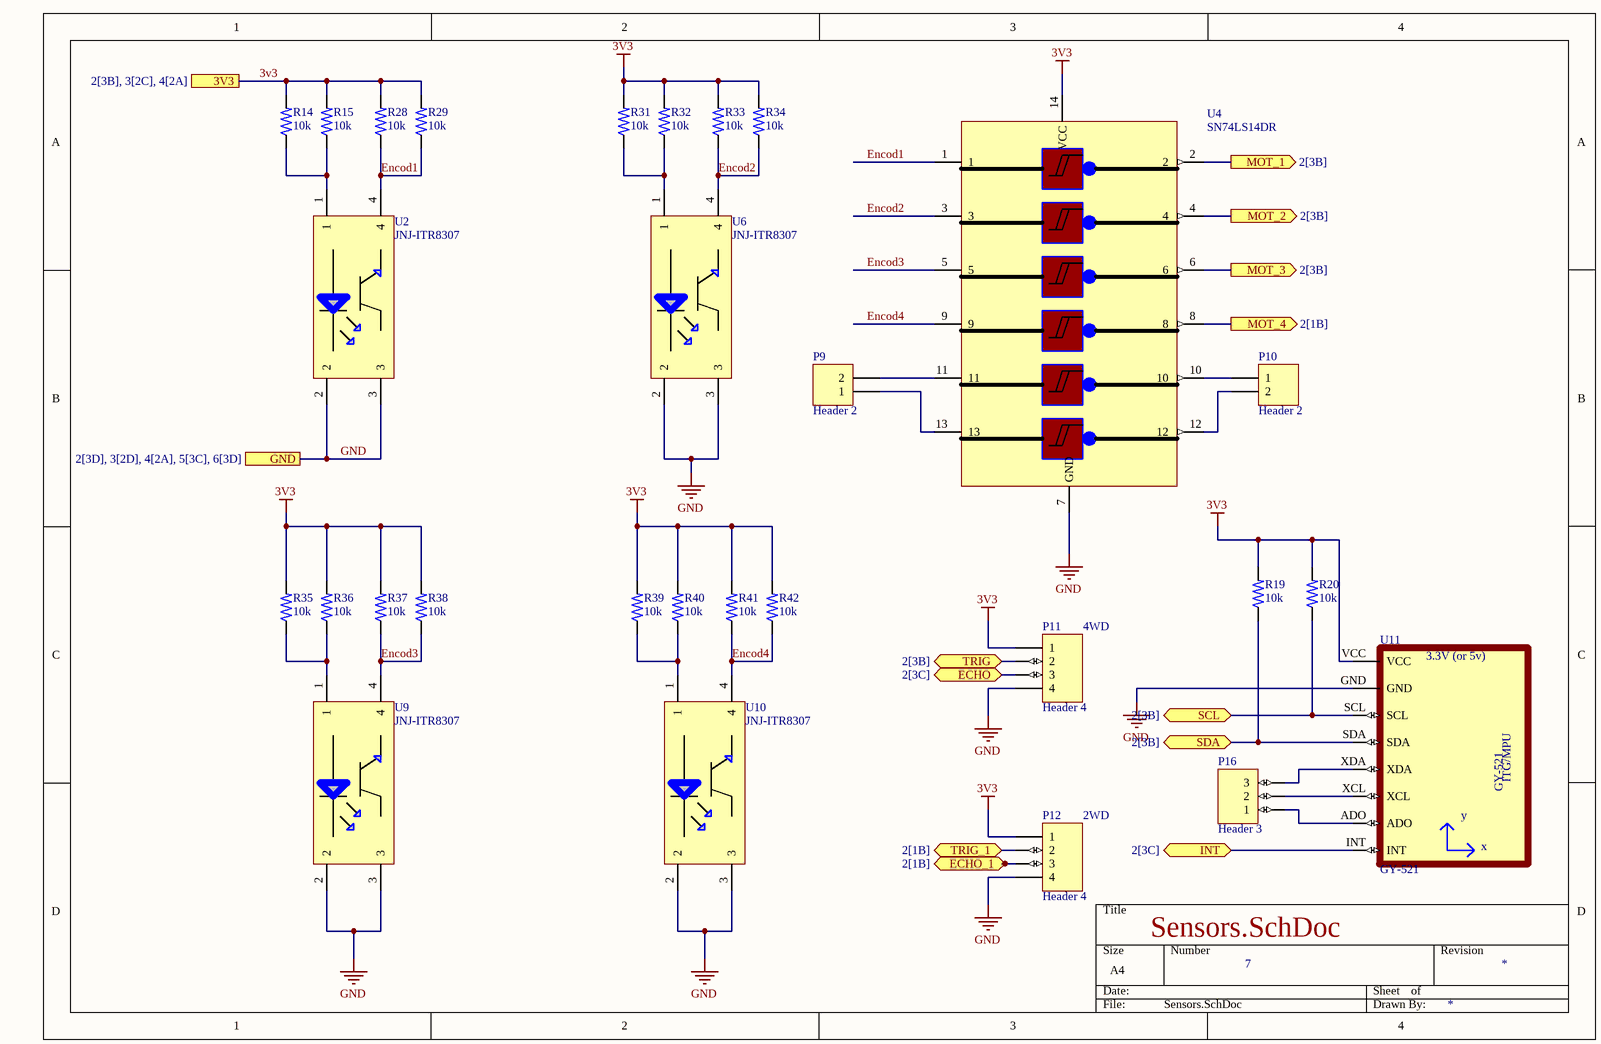
[diagram p6: Sensors.SchDoc]

### Parts
P9  Header 2  [HDR1X2]
P10  Header 2  [HDR1X2]
P11  Header 4  [HDR1X4]
P12  Header 4  [HDR1X4]
P16  Header 3  [HDR1X3]
R14  10k  [RESC3115X65N]
R15  10k  [RESC3115X65N]
R19  10k  [RESC3115X65N]
R20  10k  [RESC3115X65N]
R28  10k  [RESC3115X65N]
R29  10k  [RESC3115X65N]
R31  10k  [RESC3115X65N]
R32  10k  [RESC3115X65N]
R33  10k  [RESC3115X65N]
R34  10k  [RESC3115X65N]
R35  10k  [RESC3115X65N]
R36  10k  [RESC3115X65N]
R37  10k  [RESC3115X65N]
R38  10k  [RESC3115X65N]
R39  10k  [RESC3115X65N]
R40  10k  [RESC3115X65N]
R41  10k  [RESC3115X65N]
R42  10k  [RESC3115X65N]
U2  JNJ-ITR8307  [JNJ-ITR8307]
U4  SN74LS14DR  [SOP127P602X175-14N]
U6  JNJ-ITR8307  [JNJ-ITR8307]
U9  JNJ-ITR8307  [JNJ-ITR8307]
U10  JNJ-ITR8307  [JNJ-ITR8307]
U11  GY-521  [GY-521]

### Ports
3V3 (see 2[3B], 3[2C], 4[2A]), ECHO (bidir, see 2[3C]), ECHO_1 (bidir, see 2[1B]), GND (see 2[3D], 3[2D], 4[2A], 5[3C], 6[3D]), INT (bidir, see 2[3C]), MOT_1 (out, see 2[3B]), MOT_2 (out, see 2[3B]), MOT_3 (out, see 2[3B]), MOT_4 (out, see 2[1B]), SCL (bidir, see 2[3B]), SDA (bidir, see 2[3B]), TRIG (bidir, see 2[3B]), TRIG_1 (bidir, see 2[1B])

### Nets
3V3: P11.1 P12.1 R14.2 R15.2 R19.2 R20.2 R28.2 R29.2 R31.2 R32.2 R33.2 R34.2 R35.2 R36.2 R37.2 R38.2 R39.2 R40.2 R41.2 R42.2 U4.14(VCC) U11.VCC ; port 3V3
GND: P11.4 P12.4 U2.2 U2.3 U4.7(GND) U6.2 U6.3 U9.2 U9.3 U10.2 U10.3 U11.GND ; port GND
Encod1: R28.1 R29.1 U2.4 U4.1
Encod2: R33.1 R34.1 U4.3 U6.4
Encod3: R37.1 R38.1 U4.5 U9.4
Encod4: R41.1 R42.1 U4.9 U10.4
GLCD_CON1: R20.1 U11.SCL ; port SCL
GLCD_CON2: R19.1 U11.SDA ; port SDA
GLCD_CON3: U11.INT ; port INT
IO1: P12.2 ; port TRIG_1
IO2: P12.3 ; port ECHO_1
IO3: U4.8 ; port MOT_4
IO16: U4.2 ; port MOT_1
IO17: U4.4 ; port MOT_2
IO18: U4.6 ; port MOT_3
IO33: P11.2 ; port TRIG
IO45: P11.3 ; port ECHO
NetP9_1: P9.1 U4.13
NetP9_2: P9.2 U4.11
NetP10_1: P10.1 U4.10
NetP10_2: P10.2 U4.12
NetP16_1: P16.1 U11.ADO
NetP16_2: P16.2 U11.XCL
NetP16_3: P16.3 U11.XDA
NetR14_1: R14.1 R15.1 U2.1
NetR31_1: R31.1 R32.1 U6.1
NetR35_1: R35.1 R36.1 U9.1
NetR39_1: R39.1 R40.1 U10.1

### Notes on the sheet
- (near P11) 4WD
- (near P12) 2WD
- (in symbol GY-521) 3.3V (or 5v); ITG/MPU; y; x

### Library data of the parts
P9 P10 = Header 2: Header, 2-Pin; LatestRevisionDate: 17-Jul-2002; LatestRevisionNote: Re-released for DXP Platform.; Publisher: Altium Limited
P11 P12 = Header 4: Header, 4-Pin; LatestRevisionDate: 17-Jul-2002; LatestRevisionNote: Re-released for DXP Platform.; Publisher: Altium Limited
P16 = Header 3: Header, 3-Pin; LatestRevisionDate: 17-Jul-2002; LatestRevisionNote: Re-released for DXP Platform.; Publisher: Altium Limited
R14 R15 R19 R20 R28 R29 R31-R42 = 1-1879462-4: as R3 on sheet ESP32_S2_solo; Package: None; Price: None; Value: *; MP: 1-1879462-4; Availability: Unavailable
U2 U6 U9 U10 = JNJ-ITR8307: SMD-4P,3.4x2.7mm Reflective Optical Interrupters ROHS
U4 = SN74LS14DR: Schmitt Trigger 6 21ns@6V 2uA 2V~6V SOP-14 Inverters ROHS
U11 = GY-521: Triple Axis Accelerometer Gyro Breakout; MF: GODREAM FORDREAM CO., LIMITED; Price: None; MP: GY-521; SnapEDA_Link: https://www.snapeda.com/parts/GY-521/GODREAM+FORDREAM+CO.%252C+LIMITED/view-part/?ref=snap; Package: Package; Availability: Not in stock; Check_prices: https://www.snapeda.com/parts/GY-521/GODREAM+FORDREAM+CO.%252C+LIMITED/view-part/?ref=eda; Value: *

## Nets that join several sheets
3V3: ESP32_S2_solo (7 pins), Power Regulation (5 pins), USB (C3.2 C4.2 U3.4 U3.16), Sensors (22 pins)
GND: ESP32_S2_solo (15 pins), Power Regulation (23 pins), USB (25 pins), DC Motor Control (8 pins), DC Motor Control_2 (8 pins), Sensors (12 pins)
VBUS: Power Regulation (P8.1 V_MODE.3 V_MODE.6), USB (D1.C)
VCC: ESP32_S2_solo (P1.1), Power Regulation (7 pins), DC Motor Control (C10.1 C11.1 R4.2 U5.12), DC Motor Control_2 (C12.1 C16.1 R8.2 U7.12)
AIN1: ESP32_S2_solo (P14.3 U1.7), DC Motor Control (P6.3 U5.16)
AIN1_2: ESP32_S2_solo (P15.2 U1.21), DC Motor Control_2 (P7.3 U7.16)
AIN2: ESP32_S2_solo (P1.10 U1.6), DC Motor Control (P6.4 U5.15)
AIN2_2: ESP32_S2_solo (P15.1 U1.20), DC Motor Control_2 (P7.4 U7.15)
BIN1: ESP32_S2_solo (P1.9 U1.5), DC Motor Control (P6.5 U5.9)
BIN1_2: ESP32_S2_solo (P14.15 U1.19), DC Motor Control_2 (P7.5 U7.9)
BIN2: ESP32_S2_solo (P1.8 U1.4), DC Motor Control (P6.6 U5.10)
BIN2_2: ESP32_S2_solo (P14.14 U1.18), DC Motor Control_2 (P7.6 U7.10)
D1_N: ESP32_S2_solo (P14.9 U1.13), Power Regulation (D7.2 J9.A7 J9.B7)
D1_P: ESP32_S2_solo (P14.10 U1.14), Power Regulation (D6.2 J9.A6 J9.B6)
EN: ESP32_S2_solo (P1.7 R3.1 R18.1 U1.3), USB (C1.2 Q1.3 SW1.2)
GLCD_CON1: ESP32_S2_solo (P15.6 U1.25), Sensors (R20.1 U11.SCL)
GLCD_CON2: ESP32_S2_solo (P15.9 U1.28), Sensors (R19.1 U11.SDA)
GLCD_CON3: ESP32_S2_solo (P15.10 U1.29), Sensors (U11.INT)
IO0: ESP32_S2_solo (P15.8 U1.27), USB (C2.2 Q2.3 SW2.2)
IO1: ESP32_S2_solo (P2.10 U1.39), Sensors (P12.2)
IO2: ESP32_S2_solo (P2.9 U1.38), Sensors (P12.3)
IO3: ESP32_S2_solo (P14.11 U1.15), Sensors (U4.8)
IO16: ESP32_S2_solo (P14.5 U1.9), Sensors (U4.2)
IO17: ESP32_S2_solo (P14.6 U1.10), Sensors (U4.4)
IO18: ESP32_S2_solo (P14.7 U1.11), Sensors (U4.6)
IO33: ESP32_S2_solo (P15.5 U1.24), Sensors (P11.2)
IO45: ESP32_S2_solo (P15.7 U1.26), Sensors (P11.3)
NFAULT: ESP32_S2_solo (P14.13 U1.17), DC Motor Control (P6.1 U5.8)
NFAULT_2: ESP32_S2_solo (P14.4 U1.8), DC Motor Control_2 (P7.1 U7.8)
NSLEEP: ESP32_S2_solo (P14.8 U1.12), DC Motor Control (P6.2 R5.1 U5.1)
NSLEEP_2: ESP32_S2_solo (P15.3 U1.22), DC Motor Control_2 (P7.2 R9.1 U7.1)
UART1: ESP32_S2_solo (P2.7 U1.36), USB (U3.2)
UART2: ESP32_S2_solo (P2.8 U1.37), USB (U3.3)